# EasyEDA Pro project Remote Chess.epro

# Schematic 1x8 ChessModule
Board Name: 1x8 ChessModule_V2; Create Date: 2026-11-24; Page Name: P1; Project Name: Remote Chess; Schematic Name: 1x8 ChessModule; Update Date: 2026-11-24; Company: EasyEDA.com; Page Size: A4; Version: V2.0
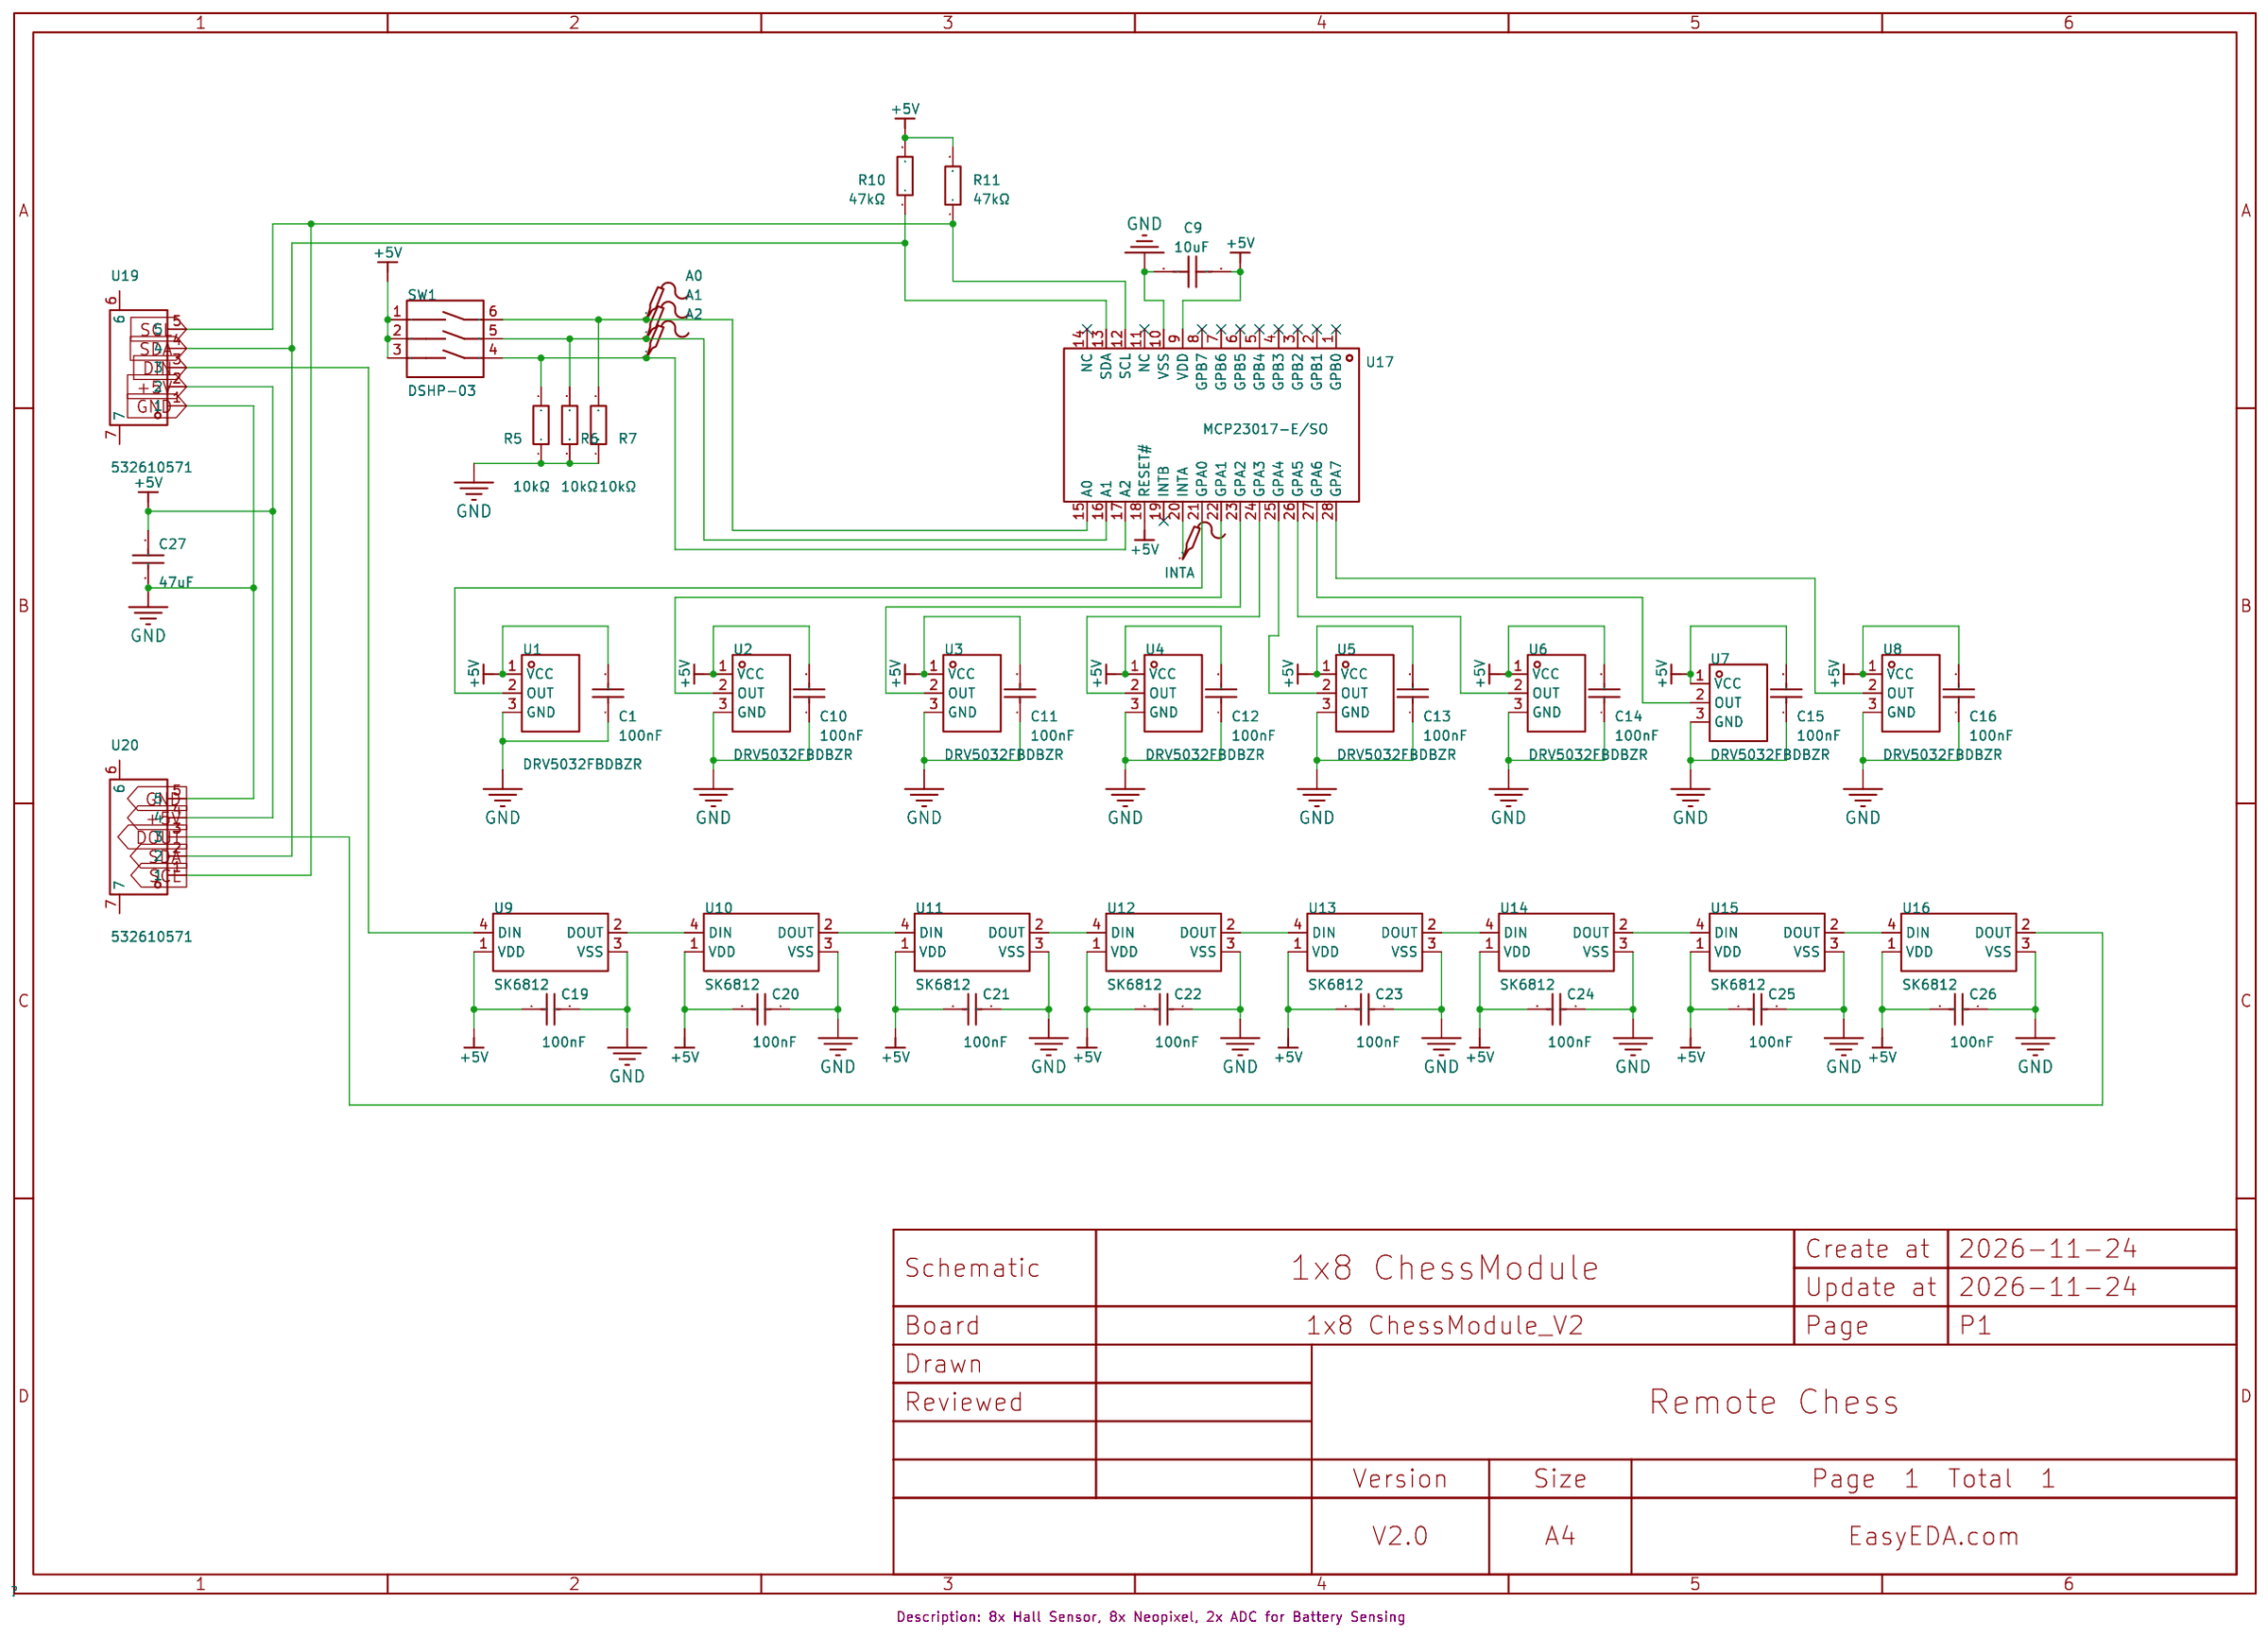
[diagram p0: schematic sheet]

## Parts
A0  -  [Test-Point-0.5mm]
A1  -  [Test-Point-0.5mm]
A2  -  [Test-Point-0.5mm]
C1  100nF  [C0805]
C9  10uF  [C0805]
C10  100nF  [C0805]
C11  100nF  [C0805]
C12  100nF  [C0805]
C13  100nF  [C0805]
C14  100nF  [C0805]
C15  100nF  [C0805]
C16  100nF  [C0805]
C19  100nF  [C0805]
C20  100nF  [C0805]
C21  100nF  [C0805]
C22  100nF  [C0805]
C23  100nF  [C0805]
C24  100nF  [C0805]
C25  100nF  [C0805]
C26  100nF  [C0805]
C27  47uF  [C0805]
INTA  -  [Test-Point-0.5mm]
R5  10kΩ  [R0805]
R6  10kΩ  [R0805]
R7  10kΩ  [R0805]
R10  47kΩ  [R0402]
R11  47kΩ  [R0402]
SW1  DSHP-03  [SW-SMD_DSHP-03]
U1  DRV5032FBDBZR  [SOT-23_L2.9-W1.3-P1.90-LS2.4-BR]
U2  DRV5032FBDBZR  [SOT-23_L2.9-W1.3-P1.90-LS2.4-BR]
U3  DRV5032FBDBZR  [SOT-23_L2.9-W1.3-P1.90-LS2.4-BR]
U4  DRV5032FBDBZR  [SOT-23_L2.9-W1.3-P1.90-LS2.4-BR]
U5  DRV5032FBDBZR  [SOT-23_L2.9-W1.3-P1.90-LS2.4-BR]
U6  DRV5032FBDBZR  [SOT-23_L2.9-W1.3-P1.90-LS2.4-BR]
U7  DRV5032FBDBZR  [SOT-23_L2.9-W1.3-P1.90-LS2.4-BR]
U8  DRV5032FBDBZR  [SOT-23_L2.9-W1.3-P1.90-LS2.4-BR]
U9  SK6812  [LED-SMD_4P-L5.0-W5.0-LS5.4-TL-1]
U10  SK6812  [LED-SMD_4P-L5.0-W5.0-LS5.4-TL-1]
U11  SK6812  [LED-SMD_4P-L5.0-W5.0-LS5.4-TL-1]
U12  SK6812  [LED-SMD_4P-L5.0-W5.0-LS5.4-TL-1]
U13  SK6812  [LED-SMD_4P-L5.0-W5.0-LS5.4-TL-1]
U14  SK6812  [LED-SMD_4P-L5.0-W5.0-LS5.4-TL-1]
U15  SK6812  [LED-SMD_4P-L5.0-W5.0-LS5.4-TL-1]
U16  SK6812  [LED-SMD_4P-L5.0-W5.0-LS5.4-TL-1]
U17  MCP23017-E/SO  [SOIC-28_L18.0-W7.5-P1.27-LS10.3-BL]
U19  532610571  [CONN-SMD_0532610571]
U20  532610571  [CONN-SMD_0532610571]

## Library data of the parts
A0-A2 INTA = Test-Point: Test Point 测试点
C1 C10-C16 C19-C26 = CL21B104KBCNNNC: Capacitance:100nF Tolerance:±10% Tolerance:±10% Voltage Rating:50V Temperature Coefficient:X7R; LCSC Part Name: 100nF ±10% 50V; Supplier Part: C1711; Manufacturer: SAMSUNG(三星); Supplier Footprint: 0805; JLCPCB Part Class: Extended Part; Datasheet: https://item.szlcsc.com/datasheet/CL21B104KBCNNNC/2063.html; Supplier: LCSC; Tolerance: ±10%; Voltage Rating: 50V; Temperature Coefficient: X7R
C9 = GRM21BR61H106KE43L: Capacitance:10uF Tolerance:±10% Tolerance:±10% Voltage Rating:50V Temperature Coefficient:X5R; LCSC Part Name: 10uF ±10% 50V; Supplier Part: C440198; Manufacturer: muRata(村田); Supplier Footprint: 0805; JLCPCB Part Class: Basic Part; Datasheet: https://item.szlcsc.com/datasheet/GRM21BR61H106KE43L/439567.html; Supplier: LCSC; Tolerance: ±10%; Voltage Rating: 50V; Temperature Coefficient: X5R
C27 = CL21A476MQYNNNE: Capacitance:47uF Tolerance:±20% Tolerance:±20% Voltage Rating:6.3V Temperature Coefficient:X5R; LCSC Part Name: 47uF ±20% 6.3V; Supplier Part: C16780; Manufacturer: SAMSUNG(三星); Supplier Footprint: 0805; JLCPCB Part Class: Basic Part; Datasheet: https://item.szlcsc.com/datasheet/CL21A476MQYNNNE/17464.html; Supplier: LCSC; Tolerance: ±20%; Voltage Rating: 6.3V; Temperature Coefficient: X5R
R5-R7 = 0805W8F1002T5E: Type:Thick Film Resistor Resistance:10kΩ Tolerance:±1% Tolerance:±1% Power(Watts):125mW Voltage-Supply(Max):150V Temperature Coefficient:±100ppm/℃ Temperature Coefficient:±100ppm/℃ Operating Temperature:-55℃~+155℃ Operating Temperature:-55℃~+155℃; LCSC Part Name: 10kΩ ±1% 125mW 厚膜电阻; Supplier Part: C17414; Manufacturer: UNI-ROYAL(厚声); Supplier Footprint: 0805; JLCPCB Part Class: Basic Part; Datasheet: https://item.szlcsc.com/datasheet/0805W8F1002T5E/18102.html; Supplier: LCSC; Type: Thick Film Resistor; Tolerance: ±1%; Power(Watts): 125mW; Voltage-Supply(Max): 150V; Temperature Coefficient: ±100ppm/℃; Operating Temperature: -55℃~+155℃
R10 R11 = 0402WGF4702TCE: Type:Thick Film Resistor Resistance:47kΩ Tolerance:±1% Tolerance:±1% Power(Watts):62.5mW Voltage-Supply(Max):50V Temperature Coefficient:±100ppm/℃ Temperature Coefficient:±100ppm/℃ Operating Temperature:-55℃~+155℃ Operating Temperature:-55℃~+155℃; LCSC Part Name: 47kΩ ±1% 62.5mW 厚膜电阻; Supplier Part: C25792; Manufacturer: UNI-ROYAL(厚声); Supplier Footprint: 0402; JLCPCB Part Class: Basic Part; Datasheet: https://item.szlcsc.com/datasheet/0402WGF4702TCE/26535.html; Supplier: LCSC; Type: Thick Film Resistor; Tolerance: ±1%; Power(Watts): 62.5mW; Voltage-Supply(Max): 50V; Temperature Coefficient: ±100ppm/℃; Operating Temperature: -55℃~+155℃
SW1 = DSHP-03: Type:Slide, Recessed Circuit:SPST Number of Positions:3 Lead Pitch:1.27mm Current Rating:25mA Voltage Rating:24V Operating Life:3,000 Cycles Color:Black; LCSC Part Name: 间距1.27mm 平拨,凹槽式 3位拨码开关; Supplier Part: C52178061; Manufacturer: Zhongdi(众迪); Supplier Footprint: SMD; JLCPCB Part Class: Extended Part; Datasheet: https://item.szlcsc.com/datasheet/DSHP-03/54999663.html; Supplier: LCSC; Type: Slide, Recessed; Circuit: SPST; Number of Positions: 3; Lead Pitch: 1.27mm; Current Rating: 25mA; Voltage Rating: 24V; Operating Life: 3,000 Cycles; Color: Black
U1-U8 = DRV5032FBDBZR: Type:Omnipolar Voltage - Supply:1.65V~5.5V Voltage - Supply:1.65V~5.5V Operation Points:±4.8mT Operation Points:±4.8mT Release Points:±5Gs Release Points:±5Gs Operating Temperature:-40℃~+85℃ Operating Temperature:-40℃~+85℃ Operating Current:690nA Sample F; LCSC Part Name: 数字锁存霍尔效应传感器; Supplier Part: C2655033; Manufacturer: TI(德州仪器); Supplier Footprint: SOT-23; JLCPCB Part Class: Extended Part; Datasheet: https://www.ti.com/cn/lit/gpn/drv5032; Supplier: LCSC; Type: Omnipolar; Voltage - Supply: 1.65V~5.5V; Operation Points: ±4.8mT; Release Points: ±5Gs; Operating Temperature: -40℃~+85℃; Operating Current: 690nA; Sample Frequency: 5Hz; Output Type: Push-Pull
U9-U16 = SK6812_C5378720: Wavelength:R:620nm~625nm；B:460nm~470nm；G:520nm~530nm Luminous Intensity:B:160mcd~320mcd；R:280mcd~515mcd；G:815mcd~1275mcd Fixed-Frequency Pwm Mode:1kHz Data Transmission Rate:800Kbit/s Voltage - Supply:3.7V~5.5V Voltage - Supply:3.7V~5.5V Quiescent Current; LCSC Part Name: 5.4x5.0x1.6毫米0.2W智能外控表面贴装SMD型LED; Supplier Part: C5378720; Manufacturer: 欧思科光电; Supplier Footprint: SMD-4P,5.4x5mm; JLCPCB Part Class: Extended Part; Datasheet: https://item.szlcsc.com/datasheet/SK6812/6242291.html; Supplier: LCSC; Wavelength: R:620nm~625nm；B:460nm~470nm；G:520nm~530nm; Luminous Intensity: B:160mcd~320mcd；R:280mcd~515mcd；G:815mcd~1275mcd; Fixed-Frequency Pwm Mode: 1kHz; Data Transmission Rate: 800Kbit/s; Voltage - Supply: 3.7V~5.5V; Quiescent Current: 0.6mA; Lens Color: Semi-transparent lens; ESD Withstand Voltage: 2000V; Operating Temperature: -40℃~+85℃; Viewing Angle: 120°; Height: 1.6mm
U17 = MCP23017-E/SO: Interface:- Number of I/O:16 Interrupt Output:With Interrupt Output Output Type:- Voltage - Supply:1.8V~5.5V Voltage - Supply:1.8V~5.5V Current - Output Low(IOL):- Current - Output High(IOH):- Clock Frequency:1.7MHz Operating Temperature:-40℃~+85℃ Operati; LCSC Part Name: 16位I/O扩展器带串行接口; Supplier Part: C47023; Manufacturer: MICROCHIP(美国微芯); Supplier Footprint: SOIC-28-300mil; JLCPCB Part Class: Extended Part; Datasheet: https://item.szlcsc.com/datasheet/MCP23017-E%252FSO/48028.html; Supplier: LCSC; Number of I/O: 16; Interrupt Output: With Interrupt Output; Voltage - Supply: 1.8V~5.5V; Clock Frequency: 1.7MHz; Operating Temperature: -40℃~+85℃
U19 U20 = 532610571_C17256390: Pins Structure:1x5P Pitch:1.25mm Mounting Type:Surface Mount, Right Angle Reference Series:PicoBlade(MX 1.25) Number of Pins:5P Number of Rows:1 Number of PINs Per Row:5 Row Spacing:- Current Rating:1A Contact Material:Phosphor Bronze Contact Plating:Tin; LCSC Part Name: 1x5P 间距:1.25mm 卧贴 系列:PicoBlade(MX 1.25); Supplier Part: C17256390; Manufacturer: MOLEX; Supplier Footprint: SMD,P=1.25mm,卧贴; JLCPCB Part Class: Extended Part; Datasheet: https://www.molex.com/content/dam/molex/molex-dot-com/products/automated/en-us/salesdrawingpdf/532/53261/532610571_sd.pdf?inline; Supplier: LCSC; Pins Structure: 1x5P; Pitch: 1.25mm; Mounting Type: Surface Mount, Right Angle; Reference Series: PicoBlade(MX 1.25); Number of Pins: 5P; Number of Rows: 1; Number of PINs Per Row: 5; Current Rating: 1A; Contact Material: Phosphor Bronze; Contact Plating: Tin; Operating Temperature: -40℃~+105℃; Voltage Rating: 125V; Plastic Material: Glass-Fiber Reinforced PA; Flame Retardant Rating: UL94V-0; Supplementary Features: Auxiliary Solder Pin; Color: White; Z-Height of the Board: 3.4mm; X-Length of Bottom Edge on Board (Spacing Line): 11.4mm; Y-Width of Bottom Edge on Board: 5.2mm

## Nets
+5V: C1.2 C9.2 C10.2 C11.2 C12.2 C13.2 C14.2 C15.2 C16.2 C19.2 C20.2 C21.2 C22.2 C23.2 C24.2 C25.2 C26.2 C27.2 R10.2 R11.2 SW1.1 SW1.2 SW1.3 U1.1(VCC) U2.1(VCC) U3.1(VCC) U4.1(VCC) U5.1(VCC) U6.1(VCC) U7.1(VCC) U8.1(VCC) U9.1(VDD) U10.1(VDD) U11.1(VDD) U12.1(VDD) U13.1(VDD) U14.1(VDD) U15.1(VDD) U16.1(VDD) U17.9(VDD) U17.18(RESET#) U19.2 U20.4
GND: C1.1 C9.1 C10.1 C11.1 C12.1 C13.1 C14.1 C15.1 C16.1 C19.1 C20.1 C21.1 C22.1 C23.1 C24.1 C25.1 C26.1 C27.1 R5.1 R6.1 R7.1 U1.3(GND) U2.3(GND) U3.3(GND) U4.3(GND) U5.3(GND) U6.3(GND) U7.3(GND) U8.3(GND) U9.3(VSS) U10.3(VSS) U11.3(VSS) U12.3(VSS) U13.3(VSS) U14.3(VSS) U15.3(VSS) U16.3(VSS) U17.10(VSS) U19.1 U20.5
DIN: U9.4(DIN) U19.3
DOUT: U16.2(DOUT) U20.3
SCL: R11.1 U17.12(SCL) U19.5 U20.1
SDA: R10.1 U17.13(SDA) U19.4 U20.2
$1N1976: U1.2(OUT) U17.21(GPA0)
$1N1983: U2.2(OUT) U17.22(GPA1)
$1N1991: U3.2(OUT) U17.23(GPA2)
$1N2002: U4.2(OUT) U17.24(GPA3)
$1N2013: U5.2(OUT) U17.25(GPA4)
$1N2021: U6.2(OUT) U17.26(GPA5)
$1N2042: U7.2(OUT) U17.27(GPA6)
$1N2049: U8.2(OUT) U17.28(GPA7)
$1N2418: U11.2(DOUT) U12.4(DIN)
$1N2438: U12.2(DOUT) U13.4(DIN)
$1N2443: U13.2(DOUT) U14.4(DIN)
$1N2448: U14.2(DOUT) U15.4(DIN)
$1N2453: U15.2(DOUT) U16.4(DIN)
$1N3626: U9.2(DOUT) U10.4(DIN)
$1N3635: U10.2(DOUT) U11.4(DIN)
$1N4316: A0.1 R7.2 SW1.6 U17.15(A0)
$1N6693: A2.1 R5.2 SW1.4 U17.17(A2)
$1N6703: A1.1 R6.2 SW1.5 U17.16(A1)
$1N37781: INTA.1 U17.20(INTA)

Not connected (* = marked no-connect by the designer): U17 1(GPB0)* 2(GPB1)* 3(GPB2)* 4(GPB3)* 5(GPB4)* 6(GPB5)* 7(GPB6)* 8(GPB7)* 11(NC)* 14(NC)* 19(INTB)*; U19 6 7; U20 6 7

# Board PCB1
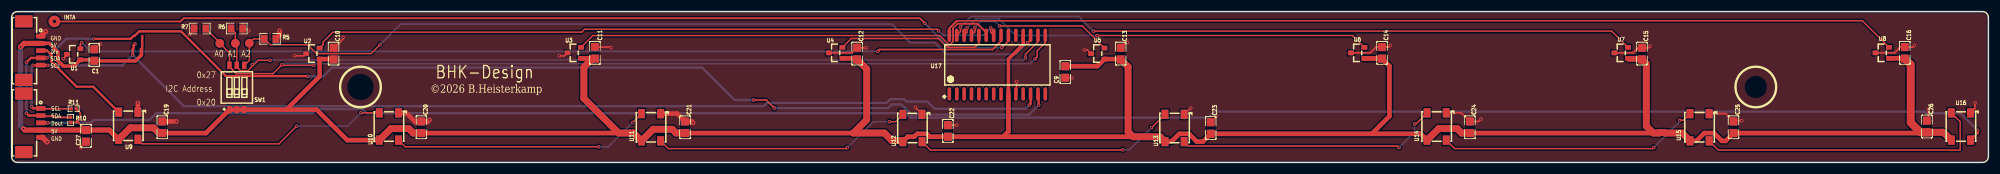
[diagram p1: board, top side]
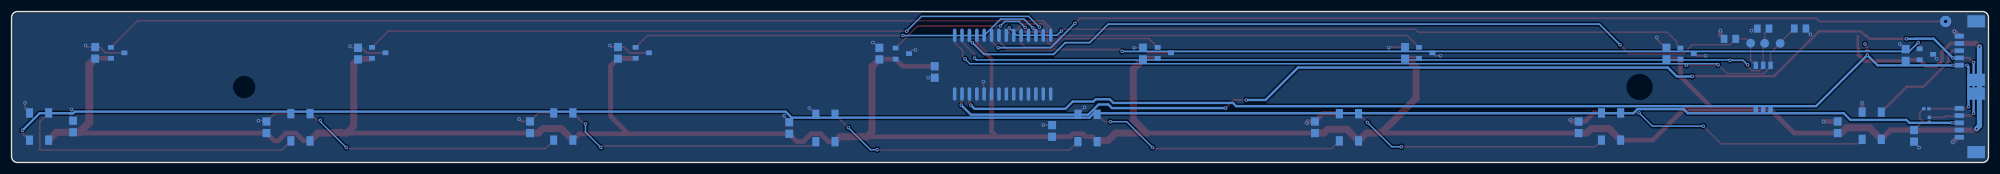
[diagram p2: board, bottom side, seen from below]

Outline 340 x 26 mm; copper layers: Top Layer, Bottom Layer. Coordinates in mm from the lower left corner of the outline.
Outline path: 0,25 0,1 arc(0.29,0.29) 1,0 339,0 arc(339.71,0.29) 340,1 340,25 arc(339.71,25.71) 339,26 1,26 arc(0.29,25.71) 0,25
Stack: Top Layer 0.035mm / Dielectric1 1.51mm FR4 er 4.5 / Bottom Layer 0.035mm

## Design rules (mm)
spacing copperThickness1oz (default): track to track 0.102, other pairs 0.152 to 0.3
spacing copperThickness2oz: track to track 0.203, other pairs 0.152 to 0.3
spacing Edge: track to track 0.152, other pairs 0 to 0.3
spacing Plane_innerPlane: track to track 0.102, other pairs 0.152 to 0.3
spacing Copper_copperRegion: track to track 0.102, other pairs 0.152 to 0.3
track width copperThickness1oz (default): min 0.2, default 0.254, max 2.54
track width copperThickness2oz: min 0.203, default 0.254, max 2.54
track width Power: min 0.3, default 2, max 2.54
track width GND: min 0.3, default 0.6, max 2.54
differential pair differentialPair (default): width min 0.127, default 0.254, max 2.54; gap min 0.152, default 0.152
net class Power uses Copper_copperRegion, Plane_innerPlane
net +5V uses Copper_copperRegion, Plane_innerPlane, Power
net $1N4316 uses Copper_copperRegion, Plane_innerPlane
net GND uses Copper_copperRegion, GND, Plane_innerPlane
net $1N1976 uses Copper_copperRegion, Plane_innerPlane
net $1N1983 uses Copper_copperRegion, Plane_innerPlane
net $1N1991 uses Copper_copperRegion, Plane_innerPlane
net $1N2002 uses Copper_copperRegion, Plane_innerPlane
net $1N2013 uses Copper_copperRegion, Plane_innerPlane
net $1N2021 uses Copper_copperRegion, Plane_innerPlane
net $1N2042 uses Copper_copperRegion, Plane_innerPlane
net $1N2049 uses Copper_copperRegion, Plane_innerPlane
net $1N3626 uses Copper_copperRegion, Plane_innerPlane
net $1N3635 uses Copper_copperRegion, Plane_innerPlane
net $1N2418 uses Copper_copperRegion, Plane_innerPlane
net $1N2438 uses Copper_copperRegion, Plane_innerPlane
net $1N2443 uses Copper_copperRegion, Plane_innerPlane
net $1N2448 uses Copper_copperRegion, Plane_innerPlane
net $1N2453 uses Copper_copperRegion, Plane_innerPlane
net $1N6693 uses Copper_copperRegion, Plane_innerPlane
net $1N6703 uses Copper_copperRegion, Plane_innerPlane
net SCL uses Copper_copperRegion, Plane_innerPlane
net SDA uses Copper_copperRegion, Plane_innerPlane
net DIN uses Copper_copperRegion, Plane_innerPlane
net DOUT uses Copper_copperRegion, Plane_innerPlane
net $1N37781 uses Copper_copperRegion, Plane_innerPlane
region e595 uses Edge
pour e596 uses Copper_copperRegion
pour e601 uses Copper_copperRegion

## Placement (name value [footprint] x y rotation side)
A0  -  [Test-Point-0.5mm#2]  35.81 20.53 0 top
A1  -  [Test-Point-0.5mm#2]  38.48 20.54 0 top
A2  -  [Test-Point-0.5mm#2]  40.89 20.56 0 top
C1  100nF  [C0805]  14.22 18.51 270 top
C9  10uF  [C0805]  181.23 15.59 90 top
C10  100nF  [C0805]  55.37 18.76 270 top
C11  100nF  [C0805]  100.33 18.89 270 top
C12  100nF  [C0805]  145.42 18.76 270 top
C13  100nF  [C0805]  190.75 18.76 270 top
C14  100nF  [C0805]  235.71 18.89 270 top
C15  100nF  [C0805]  280.42 18.76 270 top
C16  100nF  [C0805]  325.63 18.89 270 top
C19  100nF  [C0805]  25.91 6.06 270 top
C20  100nF  [C0805]  70.48 6.06 270 top
C21  100nF  [C0805]  115.82 6.06 270 top
C22  100nF  [C0805]  161.04 5.43 270 top
C23  100nF  [C0805]  206.25 5.93 270 top
C24  100nF  [C0805]  250.82 6.06 270 top
C25  100nF  [C0805]  296.16 6.06 270 top
C26  100nF  [C0805]  329.44 6.19 270 top
C27  47uF  [C0805]  12.79 4.58 90 top
INTA  -  [Test-Point-0.5mm]  7.36 24.3 0 top
R5  10kΩ  [R0805]  44.45 21.3 180 top
R6  10kΩ  [R0805]  38.73 23.08 180 top
R7  10kΩ  [R0805]  32.38 23.08 0 top
R10  47kΩ  [R0402]  10.16 7.33 270 top
R11  47kΩ  [R0402]  10.67 9.25 0 top
SW1  DSHP-03  [SW-SMD_DSHP-03]  38.73 12.92 0 top
U1  DRV5032FBDBZR  [SOT-23_L2.9-W1.3-P1.90-LS2.4-BR]  10.67 18.63 0 top
U2  DRV5032FBDBZR  [SOT-23_L2.9-W1.3-P1.90-LS2.4-BR]  51.82 18.76 0 top
U3  DRV5032FBDBZR  [SOT-23_L2.9-W1.3-P1.90-LS2.4-BR]  96.77 18.89 0 top
U4  DRV5032FBDBZR  [SOT-23_L2.9-W1.3-P1.90-LS2.4-BR]  141.73 18.89 0 top
U5  DRV5032FBDBZR  [SOT-23_L2.9-W1.3-P1.90-LS2.4-BR]  186.82 18.76 0 top
U6  DRV5032FBDBZR  [SOT-23_L2.9-W1.3-P1.90-LS2.4-BR]  231.52 18.89 0 top
U7  DRV5032FBDBZR  [SOT-23_L2.9-W1.3-P1.90-LS2.4-BR]  276.86 18.89 0 top
U8  DRV5032FBDBZR  [SOT-23_L2.9-W1.3-P1.90-LS2.4-BR]  321.76 18.89 0 top
U9  SK6812  [LED-SMD_4P-L5.0-W5.0-LS5.4-TL-1]  20.07 6.31 90 top
U10  SK6812  [LED-SMD_4P-L5.0-W5.0-LS5.4-TL-1]  64.9 6.19 90 top
U11  SK6812  [LED-SMD_4P-L5.0-W5.0-LS5.4-TL-1]  109.98 6.06 90 top
U12  SK6812  [LED-SMD_4P-L5.0-W5.0-LS5.4-TL-1]  154.94 5.93 90 top
U13  SK6812  [LED-SMD_4P-L5.0-W5.0-LS5.4-TL-1]  200.03 5.93 90 top
U14  SK6812  [LED-SMD_4P-L5.0-W5.0-LS5.4-TL-1]  245.11 6.19 90 top
U15  SK6812  [LED-SMD_4P-L5.0-W5.0-LS5.4-TL-1]  290.32 6.06 90 top
U16  SK6812  [LED-SMD_4P-L5.0-W5.0-LS5.4-TL-1]  335.28 6.19 90 top
U17  MCP23017-E/SO  [SOIC-28_L18.0-W7.5-P1.27-LS10.3-BL]  169.54 16.86 0 top
U19  532610571  [CONN-SMD_0532610571]  3.56 19.27 270 top
U20  532610571  [CONN-SMD_0532610571]  3.56 6.82 270 top

## Footprints (pads in the part's own frame, mm; a bottom-side part is the same pattern mirrored in y, then rotated)
C0805
  rect 1.41x1.35 hole 0.001: 1(-1,0) 2(1,0)
CONN-SMD_0532610571
  rect 0.8x1.6 hole 0.001: 1(-2.5,1.45) 2(-1.25,1.45) 3(0,1.45) 4(1.25,1.45) 5(2.5,1.45)
  rect 2.1x3 hole 0.001: 6(5.05,-1.45) 7(-5.05,-1.45)
LED-SMD_4P-L5.0-W5.0-LS5.4-TL-1
  rect 1.6x1.2 hole 0.001: 1(-2.35,1.65) 2(-2.35,-1.65) 3(2.35,-1.65) 4(2.35,1.65)
R0402
  rect 0.566x0.54 hole 0.001: 1(-0.433,0) 2(0.433,0)
R0805
  rect 1.133x1.377 hole 0.001: 1(-1,0) 2(1,0)
SOIC-28_L18.0-W7.5-P1.27-LS10.3-BL
  oval 0.6x2.3 hole 0.001: 1(-8.255,-5.058) 2(-6.985,-5.058) 3(-5.715,-5.058) 4(-4.445,-5.058) 5(-3.175,-5.058) 6(-1.905,-5.058) 7(-0.635,-5.058) 8(0.635,-5.058) 9(1.905,-5.058) 10(3.175,-5.058) 11(4.445,-5.058) 12(5.715,-5.058) 13(6.985,-5.058) 14(8.255,-5.058) 15(8.255,5.058) 16(6.985,5.058) 17(5.715,5.058) 18(4.445,5.058) 19(3.175,5.058) 20(1.905,5.058) 21(0.635,5.058) 22(-0.635,5.058) 23(-1.905,5.058) 24(-3.175,5.058) 25(-4.445,5.058) 26(-5.715,5.058) 27(-6.985,5.058) 28(-8.255,5.058)
SOT-23_L2.9-W1.3-P1.90-LS2.4-BR
  rect 1x0.8 hole 0.001: 1(1.15,-0.95) 2(1.15,0.95) 3(-1.15,0)
SW-SMD_DSHP-03
  rect 0.76x1.27 hole 0.001: 1(-1.27,-3.815) 2(0,-3.815) 3(1.27,-3.815) 4(1.27,3.815) 5(0,3.815) 6(-1.27,3.815)
Test-Point-0.5mm
  round 2 hole 0.001: 1(0,0)
Test-Point-0.5mm#2
  round 1.5 hole 0.001: 1(0,0)

## Nets
As in the schematic.

Pads without a net: U17 1 2 3 4 5 6 7 8 11 14 19; U19 6 7; U20 6 7

## Via types
v1: diameter 0.61, hole 0.305, Top Layer to Bottom Layer, 82 vias
v2: diameter 1.6, hole 0.6, Top Layer to Bottom Layer, 1 via

## Routing (per net, layer and track width the routed paths; a pad name or vN(x,y) marks a point on that pad's centre or on a via; arc(x,y) is an arc through that point)
+5V: length 547.1
  Top Layer w0.3: R10.2 11.12,6.9 ; 11.12,6.9 11.81,7.58 11.81,8.54 R11.2 ; 11.12,6.9 11.47,6.9 C27.2
  Top Layer w0.4: 22.47,19.65 22.47,21.81
  Top Layer w0.6: 22.33,19.51 22.33,18.51 21.33,17.51 C1.2 14.05,17.68 U1.1 10.74,16.6 8.92,16.6 8.56,16.97 8.51,16.97 7.98,17.5 7.98,19.03 6.48,20.54 5.03,20.54 U19.2 ; U17.18 173.99,20.34 171.45,17.8 U17.9
  Top Layer w0.76: 47.25,9.1 52.97,14.82 U2.1
  Top Layer w0.8: 233.95,4.93 242.36,4.93 U14.1 ; 233.95,4.93 C23.2 204.9,3.58 203.86,3.58 202.5,4.94 200.85,4.94 199.49,3.58 U13.1 ; 233.95,4.93 236.98,7.97 236.98,16.62 C14.2 232.67,17.89 U6.1 235.66,17.94 ; C24.2 282.37,5.06 ; 170.54,4.43 192.9,4.43 ; 170.54,4.43 171.45,5.33 U17.9 ; 170.54,4.43 C22.2 157.93,4.43 157.42,4.94 155.76,4.94 155.25,4.43 154.13,4.43 U12.1 ; U4.1 145.24,17.94 C12.2 ; U2.1 55.32,17.81 C10.2 ; C21.2 144.78,5.06 ; U10.1 57.72,3.84 52.46,9.1 SW1.3 SW1.2 SW1.1 33.42,5.06 C19.2 ; 325.57,17.94 U8.1 ; 99.92,17.94 U3.1 99.92,17.9 C11.2 ; U15.1 289.79,3.71 291.14,5.06 292.8,5.06 294.15,3.71 294.81,3.71 C25.2 329.31,5.06 C26.2 ; C9.2 186.74,16.59 U5.1 190.7,17.81 ; C20.2 104.41,5.06 ; C15.2 278.19,17.76 U7.1 280.24,17.94 C15.2
  Top Layer w0.9: v1(1.52,19.9) 2.14,20.52 U19.2 ; U9.1 16.8,5.58 C27.2 12.78,5.57 U20.4 2.27,5.57 v1(2.03,5.81)
  Top Layer w1.2: C13.2 192.02,16.49 192.02,5.3 192.9,4.43 197.53,4.43 U13.1 ; U16.1 332.28,5.19 C26.2 ; U15.1 287.32,5.06 284.37,5.06 284.28,5.15 283.41,5.15 283.32,5.06 282.37,5.06 281.17,6.26 281.17,17.01 C15.2 ; U14.1 245.46,5.84 248.63,5.84 249.41,5.06 C24.2 ; U10.1 65.25,5.84 68.3,5.84 69.07,5.06 C20.2 ; U12.1 153.11,3.76 151.41,3.76 150.12,5.06 144.78,5.06 147.07,7.35 147.07,16.11 C12.2 ; 99.92,17.94 99.92,17.9 98.42,16.4 98.42,11.05 104.41,5.06 106.98,5.06 U11.1 110.33,5.71 113.63,5.71 114.28,5.06 C21.2 ; U9.1 20.42,5.97 24.42,5.97 25.32,5.06 C19.2
  Top Layer w1.35: C26.2 328.33,5.19 326.64,6.87 326.64,16.87 C16.2
  Bottom Layer w0.9: v1(2.03,5.81) 1.52,6.31 v1(1.52,19.9)
GND: length 93.4
  Top Layer w0.3: v1(191.9,20.67) 191.66,20.67 C13.1 ; C22.1 v1(162.56,6.43) ; 230.37,18.89 233.7,18.89 234.7,19.89 C14.1 236.84,19.89 v1(237.11,20.16) ; U16.3 337.69,9.3 v1(337.69,10.25) ; v1(8.89,17.87) 9.52,18.5 U1.3 ; v1(11.9,2.55) 11.9,2.69 C27.1 ; v1(281.81,20.03) 281.54,19.76 C15.1 279.78,19.76 278.91,18.89 U7.3 ; v1(297.56,7.2) 296.31,7.2 C25.1 294.81,8.41 U15.3 ; C1.1 15.13,20.41 v1(15.24,20.41) ; v1(207.14,8.09) 207.14,7.82 C23.1 ; U12.3 156.59,8.35 v1(155.45,9.49) ; C9.1 v1(182.37,14.59) ; v1(103.12,19.78) 103.01,19.89 C11.1 ; U2.3 50.67,18.75 50.29,18.38 v1(48.64,18.38) ; v1(146.94,19.76) C12.1 144.54,18.89 U4.3 ; v1(327.28,20.16) 327.01,19.89 C16.1 324.87,19.89 323.87,18.89 U8.3 ; U5.3 185.03,19.4 v1(184.53,19.4) ; v1(57.02,21.56) 57.02,21.28 55.5,19.76 C10.1 ; v1(30.61,22.06) 31.38,22.84 R7.1 ; U3.3 95.12,18.38 v1(94.23,18.38) ; U13.3 202.75,9.36 v1(202.82,9.36) ; C26.1 329.69,7.44 v1(329.69,9.11) ; R6.1 40.39,23.08 v1(40.77,22.7) ; v1(252.73,7.46) 252.33,7.06 C24.1 249.35,8.54 U14.3 ; U17.10 172.85,11.93 v1(172.85,13.94)
  Top Layer w0.8: U10.3 67.88,8.54 69.35,7.06 C20.1 71.61,7.06 v1(71.88,7.33) ; 21.72,8.67 v1(21.72,10.25) ; C19.1 v1(28.32,7.06) ; U11.3 114.47,8.41 C21.1 116.98,7.06 v1(117.22,6.82) ; R5.1 46.1,21.95 v1(46.1,22.7)
  Top Layer w0.9: v1(5.84,22.57) 5.04,21.77 U19.1 ; v1(6.1,3.52) 5.29,4.32 U20.5
DIN: length 18.5
  Top Layer w0.4: U19.3 6.1,19.27 6.86,18.51 6.86,17.36 11.18,13.05 14.04,13.05 U9.4
DOUT: length 338.7
  Top Layer w0.4: v1(338.14,5.53) 338.14,5.05 U16.2
  Top Layer w0.5: v1(6.22,6.82) U20.3
  Bottom Layer w0.4: v1(6.22,6.82) 13.59,6.82 14.1,7.33 23.75,7.33 24.89,8.47 51.71,8.47 52.43,9.19 60.34,9.19 61.06,8.47 153.85,8.47 154.6,7.72 205.83,7.72 206.87,8.75 329.12,8.75 329.42,8.45 329.96,8.45 329.99,8.47 335.19,8.47 v1(338.14,5.53)
SCL: length 195.5
  Top Layer w0.3: U20.1 5.08,9.25 R11.1
  Top Layer w0.4: v1(21.21,20.41) 20.96,20.17 20.96,19.65 20.83,19.51 v1(20.83,18.51) ; v1(3.43,9.62) 3.72,9.32 U20.1 ; U17.12 175.26,10.12 v1(175.01,9.87) ; v1(6.22,16.73) 6.18,16.77 U19.5 4.97,16.73 v1(3.68,16.73)
  Bottom Layer w0.4: v1(3.43,9.62) 3.43,16.47 v1(3.68,16.73) ; v1(175.01,9.87) 174.37,9.24 158.75,9.24 157.5,10.49 153.94,10.49 153.54,10.89 151.13,10.89 150.5,10.25 129.92,10.25 129.37,9.7 29.64,9.7 v1(20.83,18.51) 19.05,16.73 v1(6.22,16.73)
SDA: length 203.4
  Top Layer w0.3: U20.2 5.11,7.97 7.37,7.97 7.57,7.76 R10.1 ; v1(131.19,9.36) 129.79,10.76 v1(127.64,10.76)
  Top Layer w0.4: v1(2.54,17.24) 3.32,18.02 U19.4 v1(6.1,18.02) ; v1(14.1,21.3) 20.46,21.3 20.96,21.81 21.14,21.81 21.92,22.59 29.15,22.59 36.86,14.88 50.87,14.88 v1(50.93,14.82) ; v1(2.54,8.47) 2.94,8.07 U20.2 ; U17.13 176.66,11.67 v1(176.66,9.87)
  Bottom Layer w0.4: v1(127.64,10.76) 124.33,10.76 118.75,16.35 55.12,16.35 53.59,14.82 v1(50.93,14.82) ; v1(14.1,21.3) 12.36,21.3 12.34,21.32 9.4,21.32 v1(6.1,18.02) ; v1(2.54,8.47) v1(2.54,17.24) ; v1(176.66,9.87) 175.01,8.22 154.81,8.22 153.03,10 151.38,10 150.75,9.36 v1(131.19,9.36)
$1N1976: length 161.7
  Top Layer w0.3: U1.2 11.82,20.42 v1(12.07,20.67) ; U17.21 170.18,20.92 168.72,19.46 149.29,19.46 v1(148.97,19.14)
  Bottom Layer w0.3: v1(148.97,19.14) 21.18,19.14 21.08,19.24 20.58,19.24 20.48,19.14 13.59,19.14 v1(12.07,20.67)
$1N1983: length 119.5
  Top Layer w0.254: U2.2 53.59,20.34 53.59,20.79 55.24,22.44 98.04,22.44 98.55,22.95 159.16,22.95 v1(159.44,22.68) ; v1(168.4,23.18) 168.4,22.42 U17.22
  Bottom Layer w0.254: v1(168.4,23.18) 167.13,21.91 160.2,21.91 v1(159.44,22.68)
$1N1991: length 83.1
  Top Layer w0.254: 161.93,20.85 161.98,20.9 161.98,23.18 ; 161.93,20.85 161.93,23.14 161.98,23.18 ; 161.93,20.85 161.42,20.35 161.17,20.35 159.65,21.87 99.96,21.87 U3.2 ; 161.98,23.18 162.69,23.9 ; 162.69,23.9 166.08,23.9 ; 162.69,23.9 162.74,23.95 166.04,23.95 166.08,23.9 ; 167.64,22.34 167.64,22.42 166.16,23.9 166.08,23.9 ; 167.64,22.34 166.08,23.9 ; 167.64,22.34 U17.23
$1N2002: length 26.4
  Top Layer w0.254: U17.24 166.37,20.54 165.67,19.84 160.92,19.84 159.39,21.36 144.41,21.36 U4.2
$1N2013: length 26.2
  Top Layer w0.254: U5.2 184.16,23.52 v1(169.93,23.52) ; v1(165.69,23.27) 165.69,22.5 U17.25
  Bottom Layer w0.254: v1(169.93,23.52) 169.17,24.28 166.71,24.28 v1(165.69,23.27)
$1N2021: length 72.5
  Top Layer w0.254: v1(186.7,21.87) 230.64,21.87 U6.2 ; U17.26 164.34,22.42 v1(164.34,23.18)
  Bottom Layer w0.254: v1(186.7,21.87) 172.73,21.87 169.89,24.71 165.86,24.71 v1(164.34,23.18)
$1N2042: length 119.5
  Top Layer w0.254: v1(163.2,23.32) 163.2,22.56 U17.27 ; U7.2 275.22,22.63 v1(186.06,22.63)
  Bottom Layer w0.254: v1(163.2,23.32) 165.06,25.17 183.52,25.17 v1(186.06,22.63)
$1N2049: length 167.2
  Top Layer w0.254: 161.29,23.07 U17.28 ; 161.29,23.07 161.29,23.18 162.52,24.42 162.63,24.42 ; 161.29,23.07 162.63,24.42 ; U8.2 318.33,24.42 162.63,24.42
$1N2418: length 44.7
  Top Layer w0.254: v1(143.76,2.57) 143.57,2.38 112.97,2.38 U11.2 ; U12.4 152.02,7.01 v1(151,7.01)
  Bottom Layer w0.254: v1(143.76,2.57) 148.21,7.01 v1(151,7.01)
$1N2438: length 44.9
  Top Layer w0.254: v1(196.09,6) U13.4 ; U12.2 158.05,2.12 191.07,2.12 v1(191.13,2.19)
  Bottom Layer w0.254: v1(191.13,2.19) 192.28,2.19 v1(196.09,6)
$1N2443: length 45.5
  Top Layer w0.254: U14.4 241.55,6.63 v1(241.3,6.63) ; v1(238.63,2.57) 238.38,2.82 202.44,2.82 U13.2
  Bottom Layer w0.254: v1(238.63,2.57) 241.3,5.23 v1(241.3,6.63)
$1N2448: length 45.2
  Top Layer w0.254: v1(282.45,2.57) 282.26,2.38 248.22,2.38 U14.2 ; U15.4 287.53,7.27 v1(286.89,7.27)
  Bottom Layer w0.254: v1(282.45,2.57) 286.89,7.01 v1(286.89,7.27)
$1N2453: length 50.9
  Top Layer w0.254: U16.4 335.15,7.02 335.15,2.12 293.56,2.12 U15.2
$1N3626: length 44.1
  Top Layer w0.254: U9.2 22.48,3.2 45.97,3.2 v1(49.02,6.25) ; v1(60.07,8.54) 63.25,8.54
  Bottom Layer w0.254: v1(60.07,8.54) 57.78,6.25 v1(49.02,6.25)
$1N3635: length 44.8
  Top Layer w0.254: U10.2 67.69,2.69 v1(100.96,2.69) ; 106.93,7.01 U11.4 ; 106.93,7.01 106.81,6.89 ; 106.93,7.01 106.93,6.89
  Bottom Layer w0.254: v1(100.96,2.69) 102.61,2.69 v1(106.81,6.89)
$1N4316: length 160.5
  Top Layer w0.254: 38.66,15.31 37.47,16.51 ; 38.66,15.31 44.96,15.31 46.38,16.73 ; 38.66,15.31 38.64,15.31 37.47,16.48 37.47,16.51 ; 37.47,16.51 SW1.6 37.47,18.87 A0.1 35.81,20.66 R7.2 ; 46.38,16.73 v1(51.97,16.73) ; 46.38,16.73 v1(46.48,16.83) ; U17.15 177.8,20.64 176.4,19.25 176.4,18.23 v1(176.02,17.85)
  Bottom Layer w0.254: v1(176.02,17.85) 175.18,17.01 46.66,17.01 v1(46.48,16.83)
$1N6693: length 146
  Top Layer w0.254: v1(63.35,20.28) 61.83,18.76 52.43,18.76 50.9,20.28 44.47,20.28 R5.2 41.63,21.3 A2.1 40.89,17.62 SW1.4 ; U17.17 175.26,21.15 v1(174.75,20.64)
  Bottom Layer w0.3: v1(63.35,20.28) 66.91,23.84 151.38,23.84 154.58,20.64 158.77,20.64 160.78,18.63 172.74,18.63 v1(174.75,20.64)
$1N6703: length 152.3
  Top Layer w0.254: U17.16 176.53,20.79 174.37,18.63 v1(174.37,17.98) ; v1(41.4,16.83) 41.4,16.58 ; 41.4,16.58 40.64,15.82 39.37,15.82 38.86,16.33 38.86,16.61 SW1.5 38.73,20.28 A1.1 38.48,22.33 R6.2 ; 41.4,16.58 42.42,17.6 v1(44.45,17.6)
  Bottom Layer w0.254: v1(41.4,16.83) 42.16,17.6 v1(44.45,17.6) 44.52,17.67 174.06,17.67 v1(174.37,17.98)
$1N37781: length 167.9
  Top Layer w0.3: U17.20 171.45,20.92 v1(170.31,19.78) ; v1(157.1,23.97) 156.21,24.86 29.59,24.86 29.04,24.3 v2(7.36,24.3)
  Bottom Layer w0.3: v1(170.31,19.78) 161.29,19.78 v1(157.1,23.97)

## Copper pours and planes (outline as drawn; the poured copper is in the pictures)
GND on Top Layer: -4.06,31.46 347.09,31.46 347.09,-5.24 -4.06,-5.24
GND on Bottom Layer: 0.25,29.3 351.03,29.3 351.03,-9.56 0.25,-9.56

## Text on the board
Top Silkscreen Layer: GND | 5V | Din | SDA | SCL | Dout | I2C Address | 0x27 | 0x20 | A0 A1 A2 | BHK-Design | ©2026 B.Heisterkamp
